# Altium schematic sheet ACTIVEBALANCE.SchDoc
size A; SheetNumber: 4; SheetTotal: 5
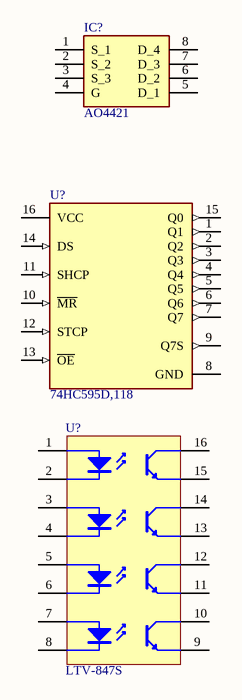
[diagram p0: ACTIVEBALANCE.SchDoc]

## Parts
(Parts that share a designator on the sheet are numbered #1, #2 ... from top to bottom, then left to right.)
IC?  AO4421  [SOIC127P600X175-8N]
U?#1  74HC595D,118  [FP-SOT109-1-IPC_C]
U?#2  LTV-847S  [LTST-LTV-847S_V]

## Nets

Not connected (* = marked no-connect by the designer): IC? 1(S_1) 2(S_2) 3(S_3) 4(G) 5(D_1) 6(D_2) 7(D_3) 8(D_4); U?#1 1(Q1) 2(Q2) 3(Q3) 4(Q4) 5(Q5) 6(Q6) 7(Q7) 8(GND) 9(Q7S) 10(~{MR}) 11(SHCP) 12(STCP) 13(~{OE}) 14(DS) 15(Q0) 16(VCC); U?#2 1(Anode1) 2(Cathode1) 3(Anode2) 4(Cathode2) 5(Anode3) 6(Cathode3) 7(Anode4) 8(Cathode4) 9(Emitter4) 10(Collector4) 11(Emitter3) 12(Collector3) 13(Emitter2) 14(Collector2) 15(Emitter1) 16(Collector1)

## Library data of the parts
IC? = AO4421: Integrated Circuit; Manufacturer_Name: Alpha & Omega Semiconductors; Datasheet Link: http://www.aosmd.com/res/data_sheets/AO4421.pdf; Height: 1.75mm; Manufacturer_Part_Number: AO4421; Arrow Part Number: AO4421; Arrow Price/Stock: https://www.arrow.com/en/products/ao4421/alpha-and-omega-semiconductor?utm_currency=USD&region=nac
U?#1 = CMP-14351-000006-1: IC SHIFT REGISTER 8BIT 16SOIC; RoHS Compliant: Yes
U?#2 = CMP-2000-06633-1: Photocoupler, 50 mA, -30 to 110 degC, 16-Pin SMD, RoHS, Tube; Manufacturer: Lite-On; Output Voltage-Max: 35V; CTR-Min: 50%; No of Channels: 4; Isolation Voltage-Max: 5000V; Package Reference: LTV-847S; Operating Temp-Max: 100°C; Datasheet Version: Rev. K, 03/2010; Datasheet URL: http://optoelectronics.liteon.com/upload/download/DS-70-96-0016/S_110_LTV-817%20%20827%20%20847%20(%20M,%20S,%20S-TA,%20S-TA1,%20S-TP%20)%20Series.pdf; Manufacturer URL: http://www.us.liteon.com/; Package Description: 16-Pin Surface Mount Device, Body 19.84 x 6.5 mm, Pitch 2.54 mm; Mounting Technology: SurfaceMount